# EasyEDA Pro project ProPrj_CraftVia-Station-S-v1-Rev0_2026-09-30.epro, board PCB1
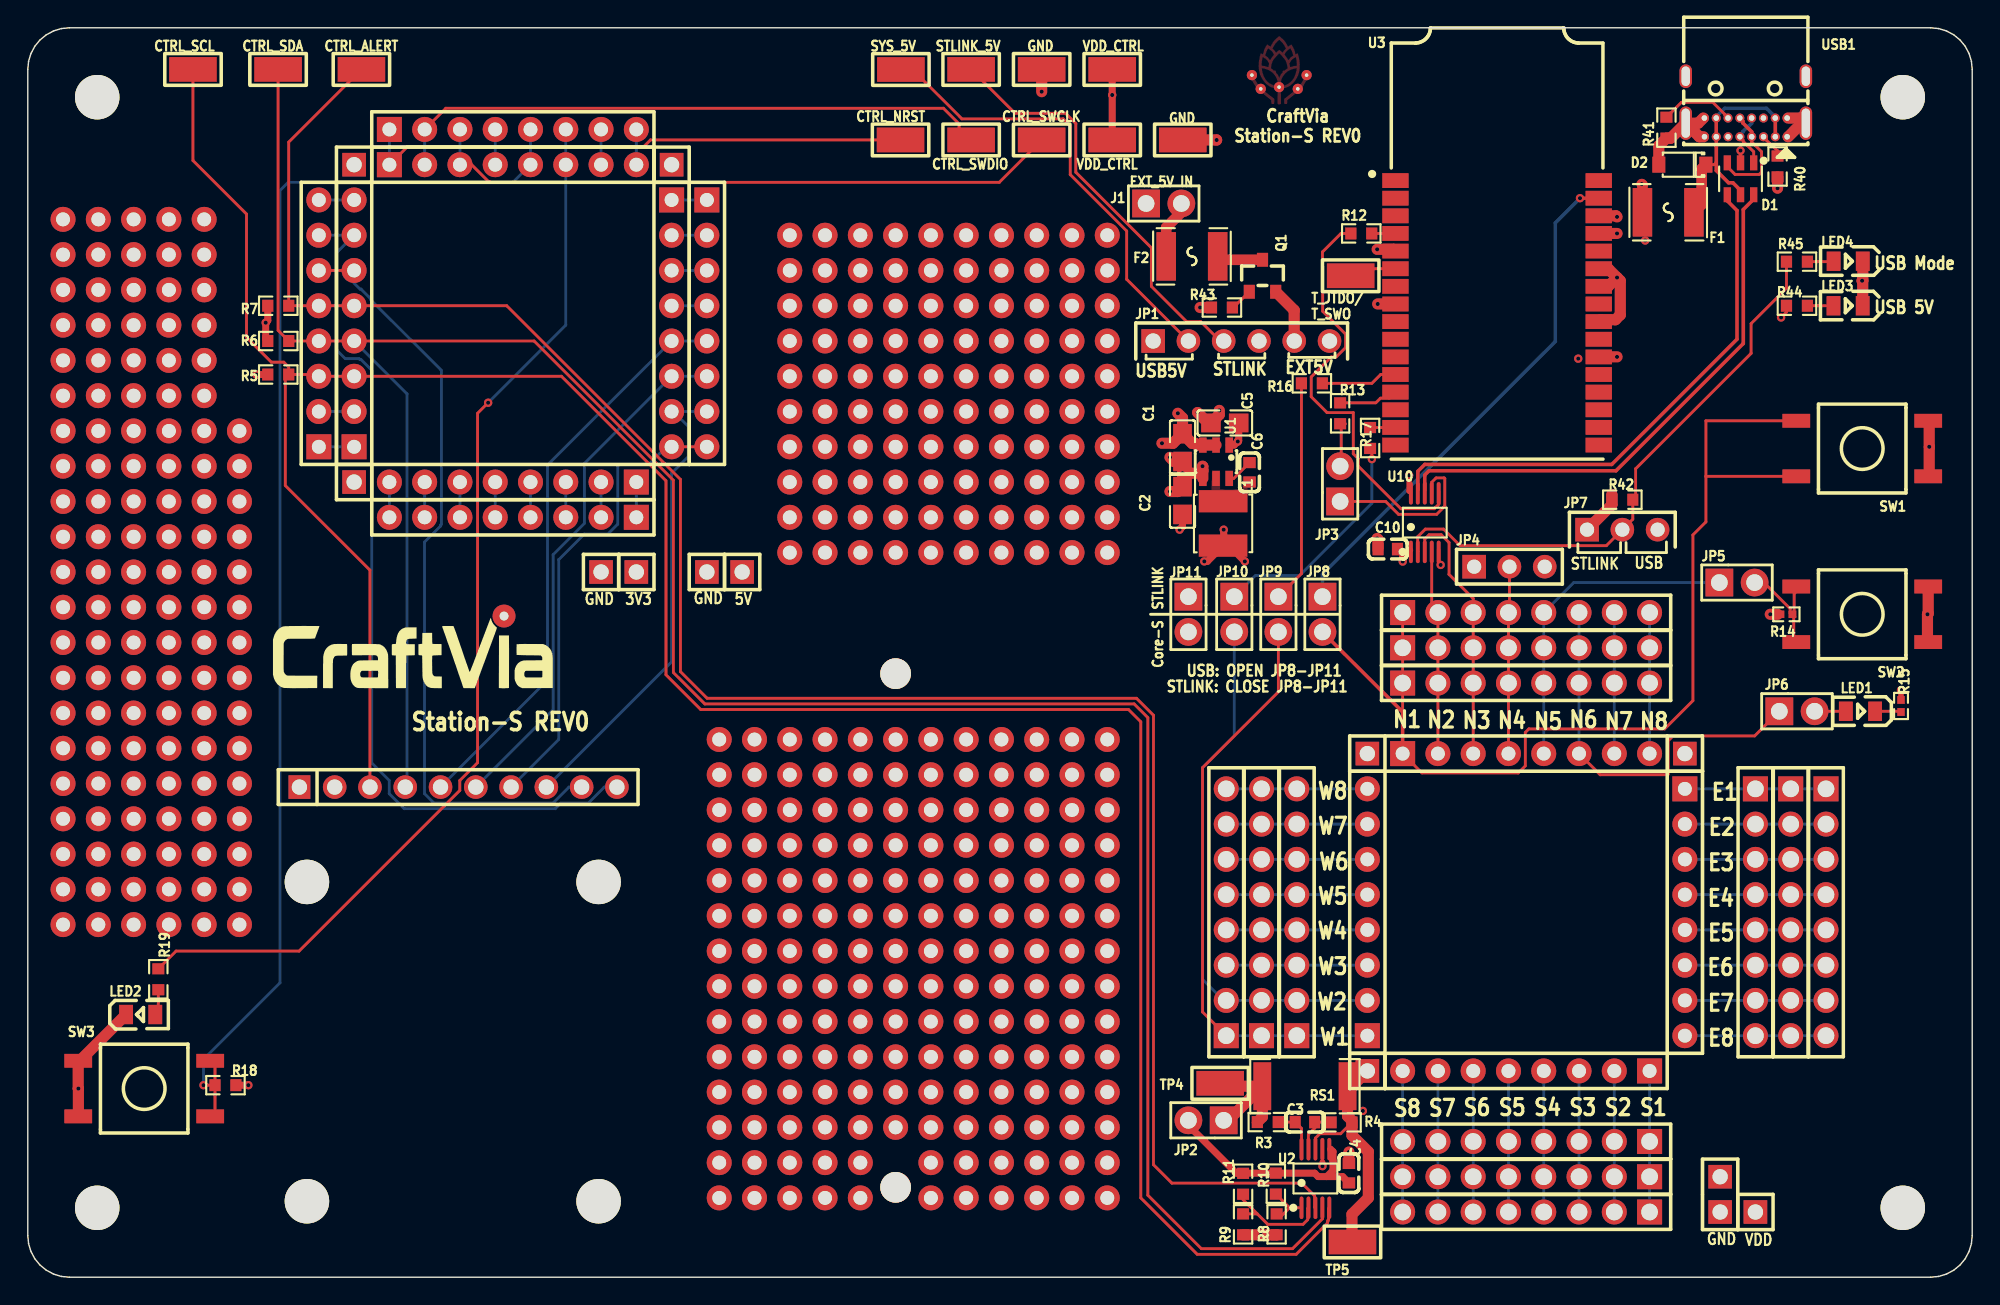
[diagram p7: board, top side]
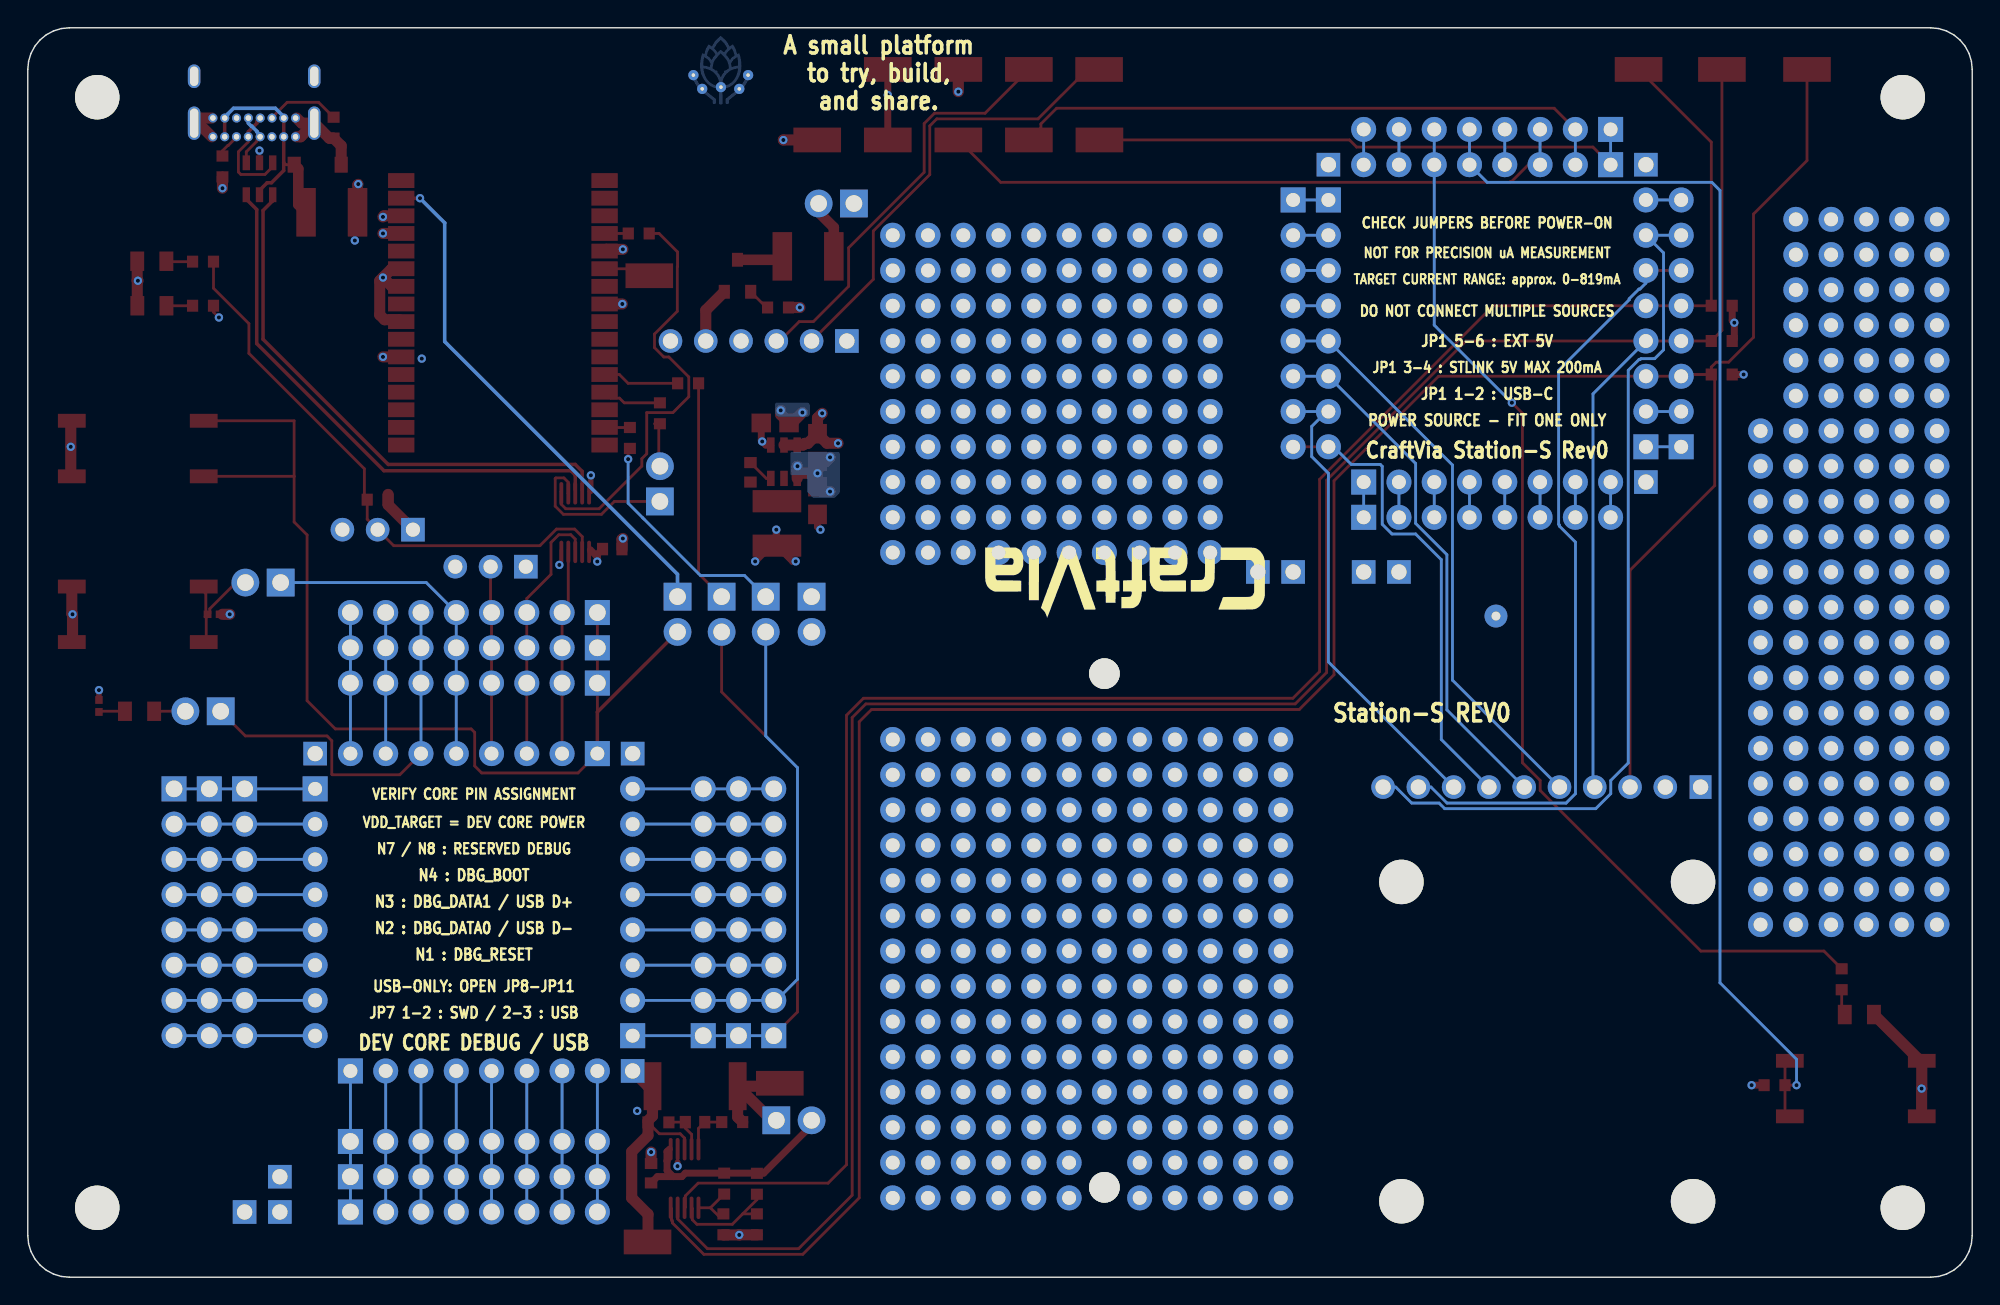
[diagram p8: board, bottom side, seen from below]

Outline 140 x 90 mm; copper layers: Top Layer, L2_GND, L3_PWR_SIG, Bottom Layer. Coordinates in mm from the lower left corner of the outline.
Outline path: 0,87 0.06,87.59 0.23,88.15 0.51,88.67 0.88,89.12 1.33,89.49 1.85,89.77 2.41,89.94 3,90 137,90 137.59,89.94 138.15,89.77 138.67,89.49 139.12,89.12 139.49,88.67 139.77,88.15 139.94,87.59 140,87 140,3 139.94,2.41 139.77,1.85 139.49,1.33 139.12,0.88 138.67,0.51 138.15,0.23 137.59,0.06 137,0 3,0 2.41,0.06 1.85,0.23 1.33,0.51 0.88,0.88 0.51,1.33 0.23,1.85 0.06,2.41 0,3 0,87
Stack: Top Layer 0.035mm / Dielectric1 1.51mm FR4 er 4.5 / Bottom Layer 0.035mm

## Design rules (mm)
spacing copperThickness1oz (default): track to track 0.2, other pairs 0.2 to 0.3
spacing copperThickness2oz: track to track 0.203, other pairs 0.152 to 0.3
track width copperThickness1oz (default): min 0.152, default 0.203, max 2.54
track width copperThickness2oz: min 0.203, default 0.254, max 2.54
track width powerTrack: min 0.203, default 0.8, max 2.54
track width powerTrackMedium: min 0.203, default 0.5, max 2.54
differential pair differentialPair (default): width min 0.127, default 0.254, max 2.54; gap min 0.152, default 0.152
net SYS_5V uses powerTrack
net GND uses copperRegion, powerTrack
net VDD_CTRL uses copperRegion, powerTrackMedium
net VDD_TARGET uses copperRegion, powerTrack
net EXT_5V uses powerTrack
net STLINK_5V uses powerTrack
net VDD_SHUNT_IN uses powerTrack
net $1N111 uses copperRegion
pour e1534 uses copperRegion1, default

## Placement (name value [footprint] x y rotation side)
C1  10uF  [C0805]  83.14 59.76 270 top
C2  22uF  [C0805]  83.14 55.95 90 top
C3  100nF  [C0603]  91.96 11.17 0 top
C4  100nF  [C0603]  95.12 7.49 270 top
C5  22uF  [C0805]  86.19 61.53 180 top
C6  100nF  [C0603]  87.97 57.98 270 top
C10  100nF  [C0603]  97.92 52.45 0 top
D1  USB ESD  [SOT-23-6_L2.9-W1.6-P0.95-LS2.8-BL]  123.32 79.12 180 top
D2  USB-C VBUS TVS  [SOD-123_L2.8-W1.8-LS3.7-RD]  119.13 80.14 180 top
F1  USB-C VBUS PTC 1.1A  [F1812]  118.11 76.71 180 top
F2  MF-MSMF050-2  [F1812]  83.82 73.53 0 top
H1  DEV_CORE_NORTH  [HDR-TH_8P-P2.54-V-M]  107.88 37.72 0 top
H2  DEV_CORE_WEST  [HDR-TH_8P-P2.54-V-M]  96.45 26.29 90 top
H3  DEV_CORE_EAST  [HDR-TH_8P-P2.54-V-M]  119.31 26.29 270 top
H4  DEV_CORE_SOUTH  [HDR-TH_8P-P2.54-V-M]  107.88 14.86 180 top
H5  DEV_KNW_SOCKET_TBD  [HDR-TH_1P-P2.54-V-M]  96.45 37.72 180 top
H6  DEV_KNE_SOCKET_TBD  [HDR-TH_1P-P2.54-V-M]  119.31 37.72 180 top
H7  DEV_KSW_SOCKET_TBD  [HDR-TH_1P-P2.54-V-M]  96.45 14.86 180 top
H8  GPIO_N_A  [HDR-TH_8P-P2.54-V-F-1]  107.88 42.8 0 top
H9  GPIO_N_B  [HDR-TH_8P-P2.54-V-F-1]  107.88 45.34 0 top
H10  GPIO_N_C  [HDR-TH_8P-P2.54-V-F-1]  107.88 47.88 0 top
H11  GPIO_E_A  [HDR-TH_8P-P2.54-V-F-1]  124.39 26.29 270 top
H12  GPIO_E_B  [HDR-TH_8P-P2.54-V-F-1]  126.93 26.29 270 top
H13  GPIO_E_C  [HDR-TH_8P-P2.54-V-F-1]  129.47 26.29 270 top
H14  GPIO_S_A  [HDR-TH_8P-P2.54-V-F-1]  107.88 9.78 180 top
H15  GPIO_S_B  [HDR-TH_8P-P2.54-V-F-1]  107.88 7.24 180 top
H16  GPIO_S_C  [HDR-TH_8P-P2.54-V-F-1]  107.88 4.7 180 top
H17  GPIO_W_A  [HDR-TH_8P-P2.54-V-F-1]  91.37 26.29 90 top
H18  GPIO_W_B  [HDR-TH_8P-P2.54-V-F-1]  88.83 26.29 90 top
H19  GPIO_W_C  [HDR-TH_8P-P2.54-V-F-1]  86.29 26.29 90 top
H20  CTRL_CORE_NORTH  [HDR-TH_8P-P2.54-V-M]  34.93 80.14 0 top
H21  CTRL_CORE_EAST  [HDR-TH_8P-P2.54-V-M]  46.36 68.71 270 top
H22  CTRL_CORE_SOUTH  [HDR-TH_8P-P2.54-V-M]  34.93 57.28 180 top
H23  CTRL_CORE_WEST  [HDR-TH_8P-P2.54-V-M]  23.5 68.71 90 top
H24  CTRL_KNW_SOCKET_TBD  [HDR-TH_1P-P2.54-V-M]  23.5 80.14 180 top
H25  CTRL_KNE_SOCKET_TBD  [HDR-TH_1P-P2.54-V-M]  46.36 80.14 180 top
H26  CTRL_KSW_SOCKET_TBD  [HDR-TH_1P-P2.54-V-M]  23.5 57.28 180 top
H27  LCD_I2C_SPI  [HDR-TH_10P-P2.54-V-F]  30.99 35.31 0 top
H28  CTRL_BREAKOUT_NORTH  [HDR-TH_8P-P2.54-V-M]  34.93 82.68 0 top
H29  CTRL_BREAKOUT_EAST  [HDR-TH_8P-P2.54-V-M]  48.9 68.71 270 top
H30  CTRL_BREAKOUT_SOUTH  [HDR-TH_8P-P2.54-V-M]  34.93 54.74 180 top
H31  CTRL_BREAKOUT_WEST  [HDR-TH_8P-P2.54-V-M]  20.96 68.71 90 top
H32  CTRL_BREAKOUT_VDD  [HDR-TH_1P-P2.54-V-M]  43.82 50.8 180 top
H33  CTRL_BREAKOUT_GND1  [HDR-TH_1P-P2.54-V-M]  48.9 50.8 180 top
H34  CTRL_BREAKOUT_GND2  [HDR-TH_1P-P2.54-V-M]  41.28 50.8 180 top
H35  DEV_BREAKOUT_VDD_TARGET  [HDR-TH_1P-P2.54-V-M]  124.39 4.7 0 top
H36  DEV_BREAKOUT_GND1  [HDR-TH_1P-P2.54-V-M]  121.85 4.7 0 top
H37  DEV_BREAKOUT_GND2  [HDR-TH_1P-P2.54-V-M]  121.85 7.24 0 top
H38  CTRL_BREAKOUT_SYS5V  [HDR-TH_1P-P2.54-V-M]  51.44 50.8 0 top
J1  PZ254V-11-02P  [HDR-TH_2P-P2.54-V-M]  81.79 77.34 0 top
JP1  PWR SOURCE: 1-2 USB-C / 3-4 STLINK / 5-6 EXT; FIT ONE ONLY  [HDR-TH_6P-P2.54-V-M]  87.38 67.44 0 top
JP2  PZ254V-11-02P  [HDR-TH_2P-P2.54-V-M]  84.84 11.3 180 top
JP3  PZ254V-11-02P  [HDR-TH_2P-P2.54-V-M]  94.49 57.15 90 top
JP4  BOOT_SEL  [HDR-TH_3P-P2.54-V-M_PZ254V-11-03P]  106.68 51.18 0 top
JP5  USER_BTN_EN (DEFAULT SHORT)  [HDR-TH_2P-P2.54-V-M]  123.06 50.04 0 top
JP6  USER_LED_EN (DEFAULT SHORT)  [HDR-TH_2P-P2.54-V-M]  127.38 40.77 0 top
JP7  DBG MODE: 1-2 SWD / 2-3 USB  [HDR-TH_3P-P2.54-V-M_PZ254V-11-03P]  114.81 53.85 0 top
JP8  NRST_ISO - FIT FOR STLINK / OPEN FOR ESP USB  [HDR-TH_2P-P2.54-V-M]  93.22 47.75 270 top
JP9  VCP_TX_ISO - FIT FOR STLINK / OPEN FOR ESP USB  [HDR-TH_2P-P2.54-V-M]  90.04 47.75 270 top
JP10  VCP_RX_ISO - FIT FOR STLINK / OPEN FOR ESP USB  [HDR-TH_2P-P2.54-V-M]  86.87 47.75 270 top
JP11  T_VCC_ISO - FIT FOR STLINK / OPEN FOR USB-ONLY  [HDR-TH_2P-P2.54-V-M]  83.57 47.75 270 top
L1  4.7uH  [IND-SMD_L4.0-W4.0]  86.06 54.3 270 top
LED1  DEV_USER_LED_GREEN  [LED0805-R-RD]  131.95 40.77 180 top
LED2  STATION_STATUS_GREEN  [LED0805-R-RD]  8.13 18.92 0 top
LED3  USB VBUS GREEN  [LED0805-R-RD]  131.06 69.98 180 top
LED4  USB MODE GREEN  [LED0805-R-RD]  131.07 73.18 180 top
NOREF  -  [Pad_e608]  2.54 48.26 0 top
NOREF#2  -  [Pad_e371]  57.4 67.44 0 top
NOREF#3  -  [Pad_e320]  65.02 52.2 0 top
NOREF#4  -  [Pad_e1858]  88.14 86.59 0 top
NOREF#5  -  [Pad_e611]  10.16 48.26 0 top
NOREF#6  -  [Pad_e309]  20.1 28.47 0 top
NOREF#7  -  [Pad_e614]  2.54 50.8 0 top
NOREF#8  -  [Pad_e335]  57.4 57.28 0 top
NOREF#9  -  [Pad_e1862]  91.44 85.6 0 top
NOREF#10  -  [Pad_e585]  5.08 38.1 0 top
NOREF#11  -  [Pad_e652]  10.16 66.04 0 top
NOREF#12  -  [Pad_e586]  7.62 38.1 0 top
NOREF#13  -  [Pad_e351]  75.18 59.82 0 top
NOREF#14  -  [Pad_e625]  15.24 53.34 0 top
NOREF#15  -  [Pad_e505]  57.4 28.58 0 top
NOREF#16  -  [Pad_e405]  77.72 72.52 0 top
NOREF#17  -  [Pad_e517]  62.48 31.11 0 top
NOREF#18  -  [Pad_e469]  67.56 18.41 0 top
NOREF#19  -  [Pad_e511]  72.64 28.58 0 top
NOREF#20  -  [Pad_e346]  62.48 59.82 0 top
NOREF#21  -  [Pad_e1707]  52.32 31.11 0 top
NOREF#22  -  [Pad_e621]  5.08 53.34 0 top
NOREF#23  -  [Pad_e375]  67.56 67.44 0 top
NOREF#24  -  [Pad_e658]  12.7 68.58 0 top
NOREF#25  -  [Pad_e399]  77.72 57.28 0 top
NOREF#26  -  [Pad_e522]  75.18 31.11 0 top
NOREF#27  -  [Pad_e484]  54.86 23.5 0 top
NOREF#28  -  [Pad_e355]  62.48 62.36 0 top
NOREF#29  -  [Pad_e521]  72.64 31.11 0 top
NOREF#30  -  [Pad_e413]  72.64 75.06 0 top
NOREF#31  -  [Pad_e1723]  52.32 23.5 0 top
NOREF#32  -  [Pad_e390]  59.94 72.52 0 top
NOREF#33  -  [Pad_e537]  62.48 36.19 0 top
NOREF#34  -  [Pad_e662]  10.16 71.12 0 top
NOREF#35  -  [Pad_e379]  54.86 69.98 0 top
NOREF#36  -  [Pad_e669]  2.54 76.2 0 top
NOREF#37  -  [Pad_e377]  72.64 67.44 0 top
NOREF#38  -  [Pad_e1716]  52.32 8.25 0 top
NOREF#39  -  [Pad_e536]  59.94 36.19 0 top
NOREF#40  -  [Pad_e567]  5.08 30.48 0 top
NOREF#41  -  [Pad_e441]  72.64 10.79 0 top
NOREF#42  -  [Pad_e615]  5.08 50.8 0 top
NOREF#43  -  [Pad_e402]  77.72 64.9 0 top
NOREF#44  -  [Pad_e482]  75.18 20.96 0 top
NOREF#45  -  [Pad_e1715]  49.78 5.72 0 top
NOREF#46  -  [Pad_e392]  65.02 72.52 0 top
NOREF#47  -  [Pad_e1719]  49.78 18.41 0 top
NOREF#48  -  [Pad_e1703]  52.32 26.03 0 top
NOREF#49  -  [Pad_e618]  12.7 50.8 0 top
NOREF#50  -  [Pad_e481]  72.64 20.96 0 top
NOREF#51  -  [Pad_e549]  67.56 38.73 0 top
NOREF#52  -  [Pad_e594]  12.7 40.64 0 top
NOREF#53  -  [Pad_e1712]  52.32 38.73 0 top
NOREF#54  -  [Pad_e347]  65.02 59.82 0 top
NOREF#55  -  [Pad_e668]  12.7 73.66 0 top
NOREF#56  -  [Pad_e1787]  34.29 47.62 0 top
NOREF#57  -  [Pad_e354]  59.94 62.36 0 top
NOREF#58  -  [Pad_e600]  12.7 43.18 0 top
NOREF#59  -  [Pad_e508]  65.02 28.58 0 top
NOREF#60  -  [Pad_e381]  59.94 69.98 0 top
NOREF#61  -  [Pad_e424]  77.72 5.72 0 top
NOREF#62  -  [Pad_e545]  57.4 38.73 0 top
NOREF#63  -  [Pad_e471]  72.64 18.41 0 top
NOREF#64  -  [Pad_e319]  62.48 52.2 0 top
NOREF#65  -  [Pad_e426]  57.4 8.25 0 top
NOREF#66  -  [Pad_e427]  59.94 8.25 0 top
NOREF#67  -  [Pad_e394]  70.1 72.52 0 top
NOREF#68  -  [Pad_e329]  65.02 54.74 0 top
NOREF#69  -  [Pad_e570]  12.7 30.48 0 top
NOREF#70  -  [Pad_e626]  2.54 55.88 0 top
NOREF#71  -  [Pad_e367]  70.1 64.9 0 top
NOREF#72  -  [Pad_e643]  15.24 60.96 0 top
NOREF#73  -  [Pad_e637]  15.24 58.42 0 top
NOREF#74  -  [Pad_e665]  5.08 73.66 0 top
NOREF#75  -  [Pad_e664]  2.54 73.66 0 top
NOREF#76  -  [Pad_e323]  72.64 52.2 0 top
NOREF#77  -  [Pad_e528]  65.02 33.66 0 top
NOREF#78  -  [Pad_e408]  59.94 75.06 0 top
NOREF#79  -  [Pad_e613]  15.24 48.26 0 top
NOREF#80  -  [Pad_e324]  75.18 52.2 0 top
NOREF#81  -  [Pad_e555]  5.08 25.4 0 top
NOREF#82  -  [Pad_e659]  2.54 71.12 0 top
NOREF#83  -  [Pad_e544]  54.86 38.73 0 top
NOREF#84  -  [Pad_e575]  10.16 33.02 0 top
NOREF#85  -  [Pad_e655]  5.08 68.58 0 top
NOREF#86  -  [Pad_e497]  62.48 26.03 0 top
NOREF#87  -  [Pad_e477]  62.48 20.96 0 top
NOREF#88  -  [Pad_e464]  54.86 18.41 0 top
NOREF#89  -  [Pad_e483]  77.72 20.96 0 top
NOREF#90  -  [Pad_e428]  65.02 8.25 0 top
NOREF#91  -  [Pad_e607]  15.24 45.72 0 top
NOREF#92  -  [Pad_e547]  62.48 38.73 0 top
NOREF#93  -  [Pad_e337]  62.48 57.28 0 top
NOREF#94  -  [Pad_e556]  7.62 25.4 0 top
NOREF#95  -  [Pad_e450]  70.1 13.34 0 top
NOREF#96  -  [Pad_e661]  7.62 71.12 0 top
NOREF#97  -  [Pad_e1718]  49.78 10.79 0 top
NOREF#98  -  [Pad_e1722]  49.78 20.96 0 top
NOREF#99  -  [Pad_e327]  59.94 54.74 0 top
NOREF#100  -  [Pad_e548]  65.02 38.73 0 top
NOREF#101  -  [Pad_e515]  57.4 31.11 0 top
NOREF#102  -  [Pad_e453]  77.72 13.34 0 top
NOREF#103  -  [Pad_e1726]  52.32 13.34 0 top
NOREF#104  -  [Pad_e407]  57.4 75.06 0 top
NOREF#105  -  [Pad_e437]  62.48 10.79 0 top
NOREF#106  -  [Pad_e363]  59.94 64.9 0 top
NOREF#107  -  [Pad_e376]  70.1 67.44 0 top
NOREF#108  -  [Pad_e1702]  49.78 26.03 0 top
NOREF#109  -  [Pad_e294]  135 85 0 top
NOREF#110  -  [Pad_e328]  62.48 54.74 0 top
NOREF#111  -  [Pad_e489]  67.56 23.5 0 top
NOREF#112  -  [Pad_e496]  59.94 26.03 0 top
NOREF#113  -  [Pad_e432]  75.18 8.25 0 top
NOREF#114  -  [Pad_e518]  65.02 31.11 0 top
NOREF#115  -  [Pad_e352]  54.86 62.36 0 top
NOREF#116  -  [Pad_e360]  75.18 62.36 0 top
NOREF#117  -  [Pad_e1717]  49.78 8.25 0 top
NOREF#118  -  [Pad_e472]  75.18 18.41 0 top
NOREF#119  -  [Pad_e461]  72.64 15.88 0 top
NOREF#120  -  [Pad_e325]  54.86 54.74 0 top
NOREF#121  -  [Pad_e498]  65.02 26.03 0 top
NOREF#122  -  [Pad_e1701]  49.78 23.5 0 top
NOREF#123  -  [Pad_e434]  54.86 10.79 0 top
NOREF#124  -  [Pad_e401]  77.72 62.36 0 top
NOREF#125  -  [Pad_e653]  12.7 66.04 0 top
NOREF#126  -  [Pad_e574]  7.62 33.02 0 top
NOREF#127  -  [Pad_e465]  57.4 18.41 0 top
NOREF#128  -  [Pad_e334]  54.86 57.28 0 top
NOREF#129  -  [Pad_e667]  10.16 73.66 0 top
NOREF#130  -  [Pad_e599]  10.16 43.18 0 top
NOREF#131  -  [Pad_e1727]  49.78 15.88 0 top
NOREF#132  -  [Pad_e474]  54.86 20.96 0 top
NOREF#133  -  [Pad_e568]  7.62 30.48 0 top
NOREF#134  -  [Pad_e433]  77.72 8.25 0 top
NOREF#135  -  [Pad_e553]  77.72 38.73 0 top
NOREF#136  -  [Pad_e589]  15.24 38.1 0 top
NOREF#137  -  [Pad_e430]  70.1 8.25 0 top
NOREF#138  -  [Pad_e523]  77.72 31.11 0 top
NOREF#139  -  [Pad_e564]  12.7 27.94 0 top
NOREF#140  -  [Pad_e533]  77.72 33.66 0 top
NOREF#141  -  [Pad_e660]  5.08 71.12 0 top
NOREF#142  -  [Pad_e454]  54.86 15.88 0 top
NOREF#143  -  [Pad_e421]  70.1 5.72 0 top
NOREF#144  -  [Pad_e386]  72.64 69.98 0 top
NOREF#145  -  [Pad_e598]  7.62 43.18 0 top
NOREF#146  -  [Pad_e485]  57.4 23.5 0 top
NOREF#147  -  [Pad_e604]  7.62 45.72 0 top
NOREF#148  -  [Pad_e411]  67.56 75.06 0 top
NOREF#149  -  [Pad_e620]  2.54 53.34 0 top
NOREF#150  -  [Pad_e507]  62.48 28.58 0 top
NOREF#151  -  [Pad_e562]  7.62 27.94 0 top
NOREF#152  -  [Pad_e622]  7.62 53.34 0 top
NOREF#153  -  [Pad_e647]  10.16 63.5 0 top
NOREF#154  -  [Pad_e534]  54.86 36.19 0 top
NOREF#155  -  [Pad_e365]  65.02 64.9 0 top
NOREF#156  -  [Pad_e560]  2.54 27.94 0 top
NOREF#157  -  [Pad_e1713]  49.78 38.73 0 top
NOREF#158  -  [Pad_e385]  70.1 69.98 0 top
NOREF#159  -  [Pad_e388]  54.86 72.52 0 top
NOREF#160  -  [Pad_e503]  77.72 26.03 0 top
NOREF#161  -  [Pad_e451]  72.64 13.34 0 top
NOREF#162  -  [Pad_e410]  65.02 75.06 0 top
NOREF#163  -  [Pad_e380]  57.4 69.98 0 top
NOREF#164  -  [Pad_e391]  62.48 72.52 0 top
NOREF#165  -  [Pad_e396]  75.18 72.52 0 top
NOREF#166  -  [Pad_e559]  15.24 25.4 0 top
NOREF#167  -  [Pad_e636]  12.7 58.42 0 top
NOREF#168  -  [Pad_e644]  2.54 63.5 0 top
NOREF#169  -  [Pad_e349]  70.1 59.82 0 top
NOREF#170  -  [Pad_e448]  65.02 13.34 0 top
NOREF#171  -  [Pad_e344]  57.4 59.82 0 top
NOREF#172  -  [Pad_e444]  54.86 13.34 0 top
NOREF#173  -  [Pad_e634]  7.62 58.42 0 top
NOREF#174  -  [Pad_e307]  20.1 5.47 0 top
NOREF#175  -  [Pad_e631]  15.24 55.88 0 top
NOREF#176  -  [Pad_e1710]  49.78 36.19 0 top
NOREF#177  -  [Pad_e455]  57.4 15.88 0 top
NOREF#178  -  [Pad_e384]  67.56 69.98 0 top
NOREF#179  -  [Pad_e291]  5 5 0 top
NOREF#180  -  [Pad_e649]  2.54 66.04 0 top
NOREF#181  -  [Pad_e550]  70.1 38.73 0 top
NOREF#182  -  [Pad_e418]  59.94 5.72 0 top
NOREF#183  -  [Pad_e525]  57.4 33.66 0 top
NOREF#184  -  [Pad_e542]  75.18 36.19 0 top
NOREF#185  -  [Pad_e624]  12.7 53.34 0 top
NOREF#186  -  [Pad_e506]  59.94 28.58 0 top
NOREF#187  -  [Pad_e331]  70.1 54.74 0 top
NOREF#188  -  [Pad_e479]  67.56 20.96 0 top
NOREF#189  -  [Pad_e612]  12.7 48.26 0 top
NOREF#190  -  [Pad_e1714]  52.32 5.72 0 top
NOREF#191  -  [Pad_e571]  15.24 30.48 0 top
NOREF#192  -  [Pad_e416]  54.86 5.72 0 top
NOREF#193  -  [Pad_e663]  12.7 71.12 0 top
NOREF#194  -  [Pad_e1709]  52.32 33.66 0 top
NOREF#195  -  [Pad_e648]  12.7 63.5 0 top
NOREF#196  -  [Pad_e343]  54.86 59.82 0 top
NOREF#197  -  [Pad_e366]  67.56 64.9 0 top
NOREF#198  -  [Pad_e633]  5.08 58.42 0 top
NOREF#199  -  [Pad_e577]  15.24 33.02 0 top
NOREF#200  -  [Pad_e403]  77.72 67.44 0 top
NOREF#201  -  [Pad_e406]  54.86 75.06 0 top
NOREF#202  -  [Pad_e654]  2.54 68.58 0 top
NOREF#203  -  [Pad_e373]  62.48 67.44 0 top
NOREF#204  -  [Pad_e639]  5.08 60.96 0 top
NOREF#205  -  [Pad_e573]  5.08 33.02 0 top
NOREF#206  -  [Pad_e316]  54.86 52.2 0 top
NOREF#207  -  [Pad_e635]  10.16 58.42 0 top
NOREF#208  -  [Pad_e1859]  92.07 86.59 0 top
NOREF#209  -  [Pad_e601]  15.24 43.18 0 top
NOREF#210  -  [Pad_e442]  75.18 10.79 0 top
NOREF#211  -  [Pad_e467]  62.48 18.41 0 top
NOREF#212  -  [Pad_e603]  5.08 45.72 0 top
NOREF#213  -  [Pad_e596]  2.54 43.18 0 top
NOREF#214  -  [Pad_e602]  2.54 45.72 0 top
NOREF#215  -  [Pad_e458]  65.02 15.88 0 top
NOREF#216  -  [Pad_e326]  57.4 54.74 0 top
NOREF#217  -  [Pad_e565]  15.24 27.94 0 top
NOREF#218  -  [Pad_e419]  65.02 5.72 0 top
NOREF#219  -  [Pad_e530]  70.1 33.66 0 top
NOREF#220  -  [Pad_e372]  59.94 67.44 0 top
NOREF#221  -  [Pad_e457]  62.48 15.88 0 top
NOREF#222  -  [Pad_e671]  7.62 76.2 0 top
NOREF#223  -  [Pad_e1704]  49.78 28.58 0 top
NOREF#224  -  [Pad_e527]  62.48 33.66 0 top
NOREF#225  -  [Pad_e646]  7.62 63.5 0 top
NOREF#226  -  [Pad_e383]  65.02 69.98 0 top
NOREF#227  -  [Pad_e480]  70.1 20.96 0 top
NOREF#228  -  [Pad_e526]  59.94 33.66 0 top
NOREF#229  -  [Pad_e382]  62.48 69.98 0 top
NOREF#230  -  [Pad_e456]  59.94 15.88 0 top
NOREF#231  -  [Pad_e333]  75.18 54.74 0 top
NOREF#232  -  [Pad_e423]  75.18 5.72 0 top
NOREF#233  -  [Pad_e610]  7.62 48.26 0 top
NOREF#234  -  [Pad_e439]  67.56 10.79 0 top
NOREF#235  -  [Pad_e353]  57.4 62.36 0 top
NOREF#236  -  [Pad_e561]  5.08 27.94 0 top
NOREF#237  -  [Pad_e591]  5.08 40.64 0 top
NOREF#238  -  [Pad_e340]  70.1 57.28 0 top
NOREF#239  -  [Pad_e581]  10.16 35.56 0 top
NOREF#240  -  [Pad_e563]  10.16 27.94 0 top
NOREF#241  -  [Pad_e1860]  90.09 85.72 0 top
NOREF#242  -  [Pad_e632]  2.54 58.42 0 top
NOREF#243  -  [Pad_e463]  77.72 15.88 0 top
NOREF#244  -  [Pad_e1725]  49.78 13.34 0 top
NOREF#245  -  [Pad_e342]  75.18 57.28 0 top
NOREF#246  -  [Pad_e551]  72.64 38.73 0 top
NOREF#247  -  [Pad_e493]  77.72 23.5 0 top
NOREF#248  -  [Pad_e292]  135 5 0 top
NOREF#249  -  [Pad_e606]  12.7 45.72 0 top
NOREF#250  -  [Pad_e539]  67.56 36.19 0 top
NOREF#251  -  [Pad_e338]  65.02 57.28 0 top
NOREF#252  -  [Pad_e509]  67.56 28.58 0 top
NOREF#253  -  [Pad_e369]  75.18 64.9 0 top
NOREF#254  -  [Pad_e310]  41.1 28.47 0 top
NOREF#255  -  [Pad_e445]  57.4 13.34 0 top
NOREF#256  -  [Pad_e398]  77.72 54.74 0 top
NOREF#257  -  [Pad_e629]  10.16 55.88 0 top
NOREF#258  -  [Pad_e1121]  62.48 6.48 0 top
NOREF#259  -  [Pad_e387]  75.18 69.98 0 top
NOREF#260  -  [Pad_e595]  15.24 40.64 0 top
NOREF#261  -  [Pad_e491]  72.64 23.5 0 top
NOREF#262  -  [Pad_e429]  67.56 8.25 0 top
NOREF#263  -  [Pad_e554]  2.54 25.4 0 top
NOREF#264  -  [Pad_e546]  59.94 38.73 0 top
NOREF#265  -  [Pad_e490]  70.1 23.5 0 top
NOREF#266  -  [Pad_e672]  10.16 76.2 0 top
NOREF#267  -  [Pad_e486]  59.94 23.5 0 top
NOREF#268  -  [Pad_e628]  7.62 55.88 0 top
NOREF#269  -  [Pad_e642]  12.7 60.96 0 top
NOREF#270  -  [Pad_e566]  2.54 30.48 0 top
NOREF#271  -  [Pad_e579]  5.08 35.56 0 top
NOREF#272  -  [Pad_e541]  72.64 36.19 0 top
NOREF#273  -  [Pad_e578]  2.54 35.56 0 top
NOREF#274  -  [Pad_e538]  65.02 36.19 0 top
NOREF#275  -  [Pad_e584]  2.54 38.1 0 top
NOREF#276  -  [Pad_e452]  75.18 13.34 0 top
NOREF#277  -  [Pad_e609]  5.08 48.26 0 top
NOREF#278  -  [Pad_e540]  70.1 36.19 0 top
NOREF#279  -  [Pad_e1720]  52.32 18.41 0 top
NOREF#280  -  [Pad_e422]  72.64 5.72 0 top
NOREF#281  -  [Pad_e449]  67.56 13.34 0 top
NOREF#282  -  [Pad_e495]  57.4 26.03 0 top
NOREF#283  -  [Pad_e623]  10.16 53.34 0 top
NOREF#284  -  [Pad_e1711]  52.32 36.19 0 top
NOREF#285  -  [Pad_e512]  75.18 28.58 0 top
NOREF#286  -  [Pad_e529]  67.56 33.66 0 top
NOREF#287  -  [Pad_e293]  5 85 0 top
NOREF#288  -  [Pad_e435]  57.4 10.79 0 top
NOREF#289  -  [Pad_e502]  75.18 26.03 0 top
NOREF#290  -  [Pad_e357]  67.56 62.36 0 top
NOREF#291  -  [Pad_e514]  54.86 31.11 0 top
NOREF#292  -  [Pad_e364]  62.48 64.9 0 top
NOREF#293  -  [Pad_e650]  5.08 66.04 0 top
NOREF#294  -  [Pad_e494]  54.86 26.03 0 top
NOREF#295  -  [Pad_e459]  67.56 15.88 0 top
NOREF#296  -  [Pad_e438]  65.02 10.79 0 top
NOREF#297  -  [Pad_e590]  2.54 40.64 0 top
NOREF#298  -  [Pad_e519]  67.56 31.11 0 top
NOREF#299  -  [Pad_e499]  67.56 26.03 0 top
NOREF#300  -  [Pad_e630]  12.7 55.88 0 top
NOREF#301  -  [Pad_e348]  67.56 59.82 0 top
NOREF#302  -  [Pad_e332]  72.64 54.74 0 top
NOREF#303  -  [Pad_e640]  7.62 60.96 0 top
NOREF#304  -  [Pad_e447]  62.48 13.34 0 top
NOREF#305  -  [Pad_e583]  15.24 35.56 0 top
NOREF#306  -  [Pad_e466]  59.94 18.41 0 top
NOREF#307  -  [Pad_e414]  75.18 75.06 0 top
NOREF#308  -  [Pad_e645]  5.08 63.5 0 top
NOREF#309  -  [Pad_e476]  59.94 20.96 0 top
NOREF#310  -  [Pad_e404]  77.72 69.98 0 top
NOREF#311  -  [Pad_e336]  59.94 57.28 0 top
NOREF#312  -  [Pad_e516]  59.94 31.11 0 top
NOREF#313  -  [Pad_e446]  59.94 13.34 0 top
NOREF#314  -  [Pad_e443]  77.72 10.79 0 top
NOREF#315  -  [Pad_e1724]  52.32 10.79 0 top
NOREF#316  -  [Pad_e617]  10.16 50.8 0 top
NOREF#317  -  [Pad_e520]  70.1 31.11 0 top
NOREF#318  -  [Pad_e638]  2.54 60.96 0 top
NOREF#319  -  [Pad_e588]  12.7 38.1 0 top
NOREF#320  -  [Pad_e317]  57.4 52.2 0 top
NOREF#321  -  [Pad_e415]  77.72 75.06 0 top
NOREF#322  -  [Pad_e673]  12.7 76.2 0 top
NOREF#323  -  [Pad_e358]  70.1 62.36 0 top
NOREF#324  -  [Pad_e468]  65.02 18.41 0 top
NOREF#325  -  [Pad_e431]  72.64 8.25 0 top
NOREF#326  -  [Pad_e656]  7.62 68.58 0 top
NOREF#327  -  [Pad_e420]  67.56 5.72 0 top
NOREF#328  -  [Pad_e651]  7.62 66.04 0 top
NOREF#329  -  [Pad_e470]  70.1 18.41 0 top
NOREF#330  -  [Pad_e389]  57.4 72.52 0 top
NOREF#331  -  [Pad_e395]  72.64 72.52 0 top
NOREF#332  -  [Pad_e350]  72.64 59.82 0 top
NOREF#333  -  [Pad_e487]  62.48 23.5 0 top
NOREF#334  -  [Pad_e412]  70.1 75.06 0 top
NOREF#335  -  [Pad_e619]  15.24 50.8 0 top
NOREF#336  -  [Pad_e552]  75.18 38.73 0 top
NOREF#337  -  [Pad_e535]  57.4 36.19 0 top
NOREF#338  -  [Pad_e330]  67.56 54.74 0 top
NOREF#339  -  [Pad_e473]  77.72 18.41 0 top
NOREF#340  -  [Pad_e1120]  62.48 43.48 0 top
NOREF#341  -  [Pad_e370]  54.86 67.44 0 top
NOREF#342  -  [Pad_e1708]  49.78 33.66 0 top
NOREF#343  -  [Pad_e409]  62.48 75.06 0 top
NOREF#344  -  [Pad_e569]  10.16 30.48 0 top
NOREF#345  -  [Pad_e558]  12.7 25.4 0 top
NOREF#346  -  [Pad_e425]  54.86 8.25 0 top
NOREF#347  -  [Pad_e532]  75.18 33.66 0 top
NOREF#348  -  [Pad_e582]  12.7 35.56 0 top
NOREF#349  -  [Pad_e393]  67.56 72.52 0 top
NOREF#350  -  [Pad_e580]  7.62 35.56 0 top
NOREF#351  -  [Pad_e362]  57.4 64.9 0 top
NOREF#352  -  [Pad_e322]  70.1 52.2 0 top
NOREF#353  -  [Pad_e417]  57.4 5.72 0 top
NOREF#354  -  [Pad_e361]  54.86 64.9 0 top
NOREF#355  -  [Pad_e359]  72.64 62.36 0 top
NOREF#356  -  [Pad_e543]  77.72 36.19 0 top
NOREF#357  -  [Pad_e627]  5.08 55.88 0 top
NOREF#358  -  [Pad_e378]  75.18 67.44 0 top
NOREF#359  -  [Pad_e339]  67.56 57.28 0 top
NOREF#360  -  [Pad_e436]  59.94 10.79 0 top
NOREF#361  -  [Pad_e341]  72.64 57.28 0 top
NOREF#362  -  [Pad_e587]  10.16 38.1 0 top
NOREF#363  -  [Pad_e308]  41.1 5.47 0 top
NOREF#364  -  [Pad_e440]  70.1 10.79 0 top
NOREF#365  -  [Pad_e531]  72.64 33.66 0 top
NOREF#366  -  [Pad_e1705]  52.32 28.58 0 top
NOREF#367  -  [Pad_e374]  65.02 67.44 0 top
NOREF#368  -  [Pad_e641]  10.16 60.96 0 top
NOREF#369  -  [Pad_e460]  70.1 15.88 0 top
NOREF#370  -  [Pad_e400]  77.72 59.82 0 top
NOREF#371  -  [Pad_e321]  67.56 52.2 0 top
NOREF#372  -  [Pad_e524]  54.86 33.66 0 top
NOREF#373  -  [Pad_e478]  65.02 20.96 0 top
NOREF#374  -  [Pad_e1721]  52.32 20.96 0 top
NOREF#375  -  [Pad_e368]  72.64 64.9 0 top
NOREF#376  -  [Pad_e356]  65.02 62.36 0 top
NOREF#377  -  [Pad_e513]  77.72 28.58 0 top
NOREF#378  -  [Pad_e557]  10.16 25.4 0 top
NOREF#379  -  [Pad_e510]  70.1 28.58 0 top
NOREF#380  -  [Pad_e397]  77.72 52.2 0 top
NOREF#381  -  [Pad_e576]  12.7 33.02 0 top
NOREF#382  -  [Pad_e605]  10.16 45.72 0 top
NOREF#383  -  [Pad_e475]  57.4 20.96 0 top
NOREF#384  -  [Pad_e500]  70.1 26.03 0 top
NOREF#385  -  [Pad_e593]  10.16 40.64 0 top
NOREF#386  -  [Pad_e616]  7.62 50.8 0 top
NOREF#387  -  [Pad_e1728]  52.32 15.88 0 top
NOREF#388  -  [Pad_e501]  72.64 26.03 0 top
NOREF#389  -  [Pad_e597]  5.08 43.18 0 top
NOREF#390  -  [Pad_e572]  2.54 33.02 0 top
NOREF#391  -  [Pad_e462]  75.18 15.88 0 top
NOREF#392  -  [Pad_e666]  7.62 73.66 0 top
NOREF#393  -  [Pad_e345]  59.94 59.82 0 top
NOREF#394  -  [Pad_e492]  75.18 23.5 0 top
NOREF#395  -  [Pad_e1706]  49.78 31.11 0 top
NOREF#396  -  [Pad_e488]  65.02 23.5 0 top
NOREF#397  -  [Pad_e504]  54.86 28.58 0 top
NOREF#398  -  [Pad_e1861]  88.77 85.6 0 top
NOREF#399  -  [Pad_e670]  5.08 76.2 0 top
NOREF#400  -  [Pad_e318]  59.94 52.2 0 top
NOREF#401  -  [Pad_e657]  10.16 68.58 0 top
NOREF#402  -  [Pad_e592]  7.62 40.64 0 top
Q1  AO3401A  [SOT-23_L2.9-W1.3-P1.90-LS2.4-BR]  88.9 72.14 270 top
R3  10Ω  [R0603]  89.28 11.18 0 top
R4  10Ω  [R0603]  94.59 11.16 0 top
R5  4.7kΩ  [R0603]  18.03 65.02 180 top
R6  4.7kΩ  [R0603]  18.03 67.44 180 top
R7  10kΩ  [R0603]  18.03 69.98 180 top
R8  0Ω  [R0603]  89.92 3.81 90 top
R9  0Ω  [R0603]  87.5 3.81 90 top
R10  0Ω  [R0603]  89.86 6.74 270 top
R11  0Ω  [R0603]  87.5 6.73 270 top
R12  0Ω  [R0603]  96.01 75.18 180 top
R13  0Ω  [R0603]  94.49 62.23 270 top
R14  10kΩ  [R0402]  126.62 47.75 180 top
R15  1kΩ  [R0402]  134.87 41.15 270 top
R16  0Ω  [R0603]  92.46 64.39 180 top
R17  0Ω  [R0603]  96.65 60.45 270 top
R18  10kΩ  [R0603]  14.23 13.83 180 top
R19  1kΩ  [R0603]  9.4 21.46 270 top
R40  5.1kΩ  [R0603]  125.98 80.01 90 top
R41  5.1kΩ  [R0603]  117.98 82.8 90 top
R42  100kΩ  [R0603]  114.81 56.01 0 top
R43  100kΩ  [R0603]  85.98 69.85 0 top
R44  2.2kΩ  [R0603]  127.38 69.98 0 top
R45  2.2kΩ  [R0603]  127.38 73.15 0 top
RS1  100mΩ  [R2512]  91.96 13.76 0 top
SW1  DEV_RESET  [SW-SMD_4P-L6.4-W6.3-P4.00-LS9.5]  132.08 59.69 0 top
SW2  DEV_USER  [SW-SMD_4P-L6.4-W6.3-P4.00-LS9.5]  132.08 47.75 0 top
SW3  STATION_USER  [SW-SMD_4P-L6.4-W6.3-P4.00-LS9.5]  8.38 13.59 180 top
TP1  STLINK_5V  [CONN-SMD_5017]  67.92 87 0 top
TP2  SYS_5V  [CONN-SMD_5017]  62.87 87 0 top
TP3  VDD_CTRL  [CONN-SMD_5017]  78.08 87 0 top
TP4  VDD_SHUNT_IN  [CONN-SMD_5017]  85.85 13.97 0 top
TP5  VDD_TARGET  [CONN-SMD_5017]  95.38 2.54 0 top
TP6  GND  [CONN-SMD_5017]  73 87 0 top
TP7  MEAS_SCL  [CONN-SMD_5017]  11.89 87 0 top
TP8  MEAS_SDA  [CONN-SMD_5017]  18.02 87 0 top
TP9  MEAS_ALERT  [CONN-SMD_5017]  24.02 87 0 top
TP10  CTRL_NRST  [CONN-SMD_5017]  62.84 81.92 0 top
TP11  CTRL_SWDIO  [CONN-SMD_5017]  67.92 81.92 0 top
TP12  CTRL_SWCLK  [CONN-SMD_5017]  73 81.92 0 top
TP13  VDD_CTRL  [CONN-SMD_5017]  78.08 81.92 0 top
TP14  GND  [CONN-SMD_5017]  83.16 81.92 0 top
TP15  STLINK_SWO_TDO  [CONN-SMD_5017]  95.25 72.14 0 top
U1  AP63203WU-7  [TSOT-26_L2.9-W1.6-P0.95-LS2.8-BL]  85.55 58.74 180 top
U2  INA226AIDGSR  [MSOP-10_L3.0-W3.0-P0.50-LS5.0-BL]  92.71 7.11 0 top
U3  STLINK-V3MODS  [COMM-SMD_STLINK-V3MODS_1]  105.79 69.47 0 top
U10  USB / SWD MUX  [MSOP-10_L3.0-W3.0-P0.50-LS5.0-BL]  100.58 54.36 0 top
USB1  ESP32 USB-C / USB4085-GF-A (TH)  [USC-C-SMD_USB4085-GF-A]  123.7 84.33 180 top

## Footprints (pads in the part's own frame, mm; a bottom-side part is the same pattern mirrored in y, then rotated)
C0603
  rect 0.8x0.9 smd: 1(-0.7,0) 2(0.7,0)
C0805
  rect 1.41x1.35 smd: 1(-1,0) 2(1,0)
COMM-SMD_STLINK-V3MODS_1
  rect 1.9x1.07 smd: 1(-7.32,9.525) 2(-7.32,8.255) 3(-7.32,6.985) 4(-7.32,5.715) 5(-7.32,4.445) 6(-7.32,3.175) 7(-7.32,1.905) 8(-7.32,0.635) 9(-7.32,-0.635) 10(-7.32,-1.905) 11(-7.32,-3.175) 12(-7.32,-4.445) 13(-7.32,-5.715) 14(-7.32,-6.985) 15(-7.32,-8.255) 16(-7.32,-9.525) 17(7.32,-9.525) 18(7.32,-8.255) 19(7.32,-6.985) 20(7.32,-5.715) 21(7.32,-4.445) 22(7.32,-3.175) 23(7.32,-1.905) 24(7.32,-0.635) 25(7.32,0.635) 26(7.32,1.905) 27(7.32,3.175) 28(7.32,4.445) 29(7.32,5.715) 30(7.32,6.985) 31(7.32,8.255) 32(7.32,9.525)
CONN-SMD_5017
  rect 3.43x1.78 smd: 1(0,0)
F1812
  rect 1.407x3.499 smd: 1(-1.853,0) 2(1.853,0)
HDR-TH_1P-P2.54-V-M
  rect 1.7x1.7 hole 1.1: 1(0,0)
HDR-TH_2P-P2.54-V-M
  rect 2x2 hole 1.2: 1(-1.27,0)
  round 2 hole 1.2: 2(1.27,0)
HDR-TH_3P-P2.54-V-M_PZ254V-11-03P
  rect 1.7x1.7 hole 1.02: 1(-2.54,0)
  round 1.7 hole 1.02: 2(0,0) 3(2.54,0)
HDR-TH_6P-P2.54-V-M
  rect 1.7x1.7 hole 1.1: 1(-6.35,0)
  round 1.7 hole 1.1: 2(-3.81,0) 3(-1.27,0) 4(1.27,0) 5(3.81,0) 6(6.35,0)
HDR-TH_8P-P2.54-V-F-1
  rect 1.801x1.801 hole 1.2: 1(-8.89,0)
  round 1.801 hole 1.2: 2(-6.35,0) 3(-3.81,0) 4(-1.27,0) 5(1.27,0) 6(3.81,0) 7(6.35,0) 8(8.89,0)
HDR-TH_8P-P2.54-V-M
  rect 1.801x1.801 hole 1: 1(-8.89,0)
  round 1.801 hole 1: 2(-6.35,0) 3(-3.81,0) 4(-1.27,0) 5(1.27,0) 6(3.81,0) 7(6.35,0) 8(8.89,0)
HDR-TH_10P-P2.54-V-F
  rect 1.575x1.7 hole 1.1: 1(-11.43,0)
  round 1.7 hole 1.1: 2(-8.89,0) 3(-6.35,0) 4(-3.81,0) 5(-1.27,0) 6(1.27,0) 7(3.81,0) 8(6.35,0) 9(8.89,0) 10(11.43,0)
IND-SMD_L4.0-W4.0
  rect 1.6x3.5 smd: 1(-1.6,0) 2(1.6,0)
LED0805-R-RD
  rect 1x1.399 smd: 1(1.05,0) 2(-1.05,0)
MSOP-10_L3.0-W3.0-P0.50-LS5.0-BL
  oval 0.28x1.62 smd: 1(-1,-2.11) 2(-0.5,-2.11) 3(0,-2.11) 4(0.5,-2.11) 5(1,-2.11) 6(1,2.11) 7(0.5,2.11) 8(0,2.11) 9(-0.5,2.11) 10(-1,2.11)
Pad_e291
  round 3.2 hole 3.2: MH1(0,0)
Pad_e292
  round 3.2 hole 3.2: MH2(0,0)
Pad_e293
  round 3.2 hole 3.2: MH3(0,0)
Pad_e294
  round 3.2 hole 3.2: MH4(0,0)
Pad_e307
  round 3.2 hole 3.2: MH_LCD1(0,0)
Pad_e308
  round 3.2 hole 3.2: MH_LCD2(0,0)
Pad_e309
  round 3.2 hole 3.2: MH_LCD3(0,0)
Pad_e310
  round 3.2 hole 3.2: MH_LCD4(0,0)
Pad_e316
  round 1.801 hole 1: PROTO_R01C01(0,0)
Pad_e317
  round 1.801 hole 1: PROTO_R01C02(0,0)
Pad_e318
  round 1.801 hole 1: PROTO_R01C03(0,0)
Pad_e319
  round 1.801 hole 1: PROTO_R01C04(0,0)
Pad_e320
  round 1.801 hole 1: PROTO_R01C05(0,0)
Pad_e321
  round 1.801 hole 1: PROTO_R01C06(0,0)
Pad_e322
  round 1.801 hole 1: PROTO_R01C07(0,0)
Pad_e323
  round 1.801 hole 1: PROTO_R01C08(0,0)
Pad_e324
  round 1.801 hole 1: PROTO_R01C09(0,0)
Pad_e325
  round 1.801 hole 1: PROTO_R02C01(0,0)
Pad_e326
  round 1.801 hole 1: PROTO_R02C02(0,0)
Pad_e327
  round 1.801 hole 1: PROTO_R02C03(0,0)
Pad_e328
  round 1.801 hole 1: PROTO_R02C04(0,0)
Pad_e329
  round 1.801 hole 1: PROTO_R02C05(0,0)
Pad_e330
  round 1.801 hole 1: PROTO_R02C06(0,0)
Pad_e331
  round 1.801 hole 1: PROTO_R02C07(0,0)
Pad_e332
  round 1.801 hole 1: PROTO_R02C08(0,0)
Pad_e333
  round 1.801 hole 1: PROTO_R02C09(0,0)
Pad_e334
  round 1.801 hole 1: PROTO_R03C01(0,0)
Pad_e335
  round 1.801 hole 1: PROTO_R03C02(0,0)
Pad_e336
  round 1.801 hole 1: PROTO_R03C03(0,0)
Pad_e337
  round 1.801 hole 1: PROTO_R03C04(0,0)
Pad_e338
  round 1.801 hole 1: PROTO_R03C05(0,0)
Pad_e339
  round 1.801 hole 1: PROTO_R03C06(0,0)
Pad_e340
  round 1.801 hole 1: PROTO_R03C07(0,0)
Pad_e341
  round 1.801 hole 1: PROTO_R03C08(0,0)
Pad_e342
  round 1.801 hole 1: PROTO_R03C09(0,0)
Pad_e343
  round 1.801 hole 1: PROTO_R04C01(0,0)
Pad_e344
  round 1.801 hole 1: PROTO_R04C02(0,0)
Pad_e345
  round 1.801 hole 1: PROTO_R04C03(0,0)
Pad_e346
  round 1.801 hole 1: PROTO_R04C04(0,0)
Pad_e347
  round 1.801 hole 1: PROTO_R04C05(0,0)
Pad_e348
  round 1.801 hole 1: PROTO_R04C06(0,0)
Pad_e349
  round 1.801 hole 1: PROTO_R04C07(0,0)
Pad_e350
  round 1.801 hole 1: PROTO_R04C08(0,0)
Pad_e351
  round 1.801 hole 1: PROTO_R04C09(0,0)
Pad_e352
  round 1.801 hole 1: PROTO_R05C01(0,0)
Pad_e353
  round 1.801 hole 1: PROTO_R05C02(0,0)
Pad_e354
  round 1.801 hole 1: PROTO_R05C03(0,0)
Pad_e355
  round 1.801 hole 1: PROTO_R05C04(0,0)
Pad_e356
  round 1.801 hole 1: PROTO_R05C05(0,0)
Pad_e357
  round 1.801 hole 1: PROTO_R05C06(0,0)
Pad_e358
  round 1.801 hole 1: PROTO_R05C07(0,0)
Pad_e359
  round 1.801 hole 1: PROTO_R05C08(0,0)
Pad_e360
  round 1.801 hole 1: PROTO_R05C09(0,0)
Pad_e361
  round 1.801 hole 1: PROTO_R06C01(0,0)
Pad_e362
  round 1.801 hole 1: PROTO_R06C02(0,0)
Pad_e363
  round 1.801 hole 1: PROTO_R06C03(0,0)
Pad_e364
  round 1.801 hole 1: PROTO_R06C04(0,0)
Pad_e365
  round 1.801 hole 1: PROTO_R06C05(0,0)
Pad_e366
  round 1.801 hole 1: PROTO_R06C06(0,0)
Pad_e367
  round 1.801 hole 1: PROTO_R06C07(0,0)
Pad_e368
  round 1.801 hole 1: PROTO_R06C08(0,0)
Pad_e369
  round 1.801 hole 1: PROTO_R06C09(0,0)
Pad_e370
  round 1.801 hole 1: PROTO_R07C01(0,0)
Pad_e371
  round 1.801 hole 1: PROTO_R07C02(0,0)
Pad_e372
  round 1.801 hole 1: PROTO_R07C03(0,0)
Pad_e373
  round 1.801 hole 1: PROTO_R07C04(0,0)
Pad_e374
  round 1.801 hole 1: PROTO_R07C05(0,0)
Pad_e375
  round 1.801 hole 1: PROTO_R07C06(0,0)
Pad_e376
  round 1.801 hole 1: PROTO_R07C07(0,0)
Pad_e377
  round 1.801 hole 1: PROTO_R07C08(0,0)
Pad_e378
  round 1.801 hole 1: PROTO_R07C09(0,0)
Pad_e379
  round 1.801 hole 1: PROTO_R08C01(0,0)
Pad_e380
  round 1.801 hole 1: PROTO_R08C02(0,0)
Pad_e381
  round 1.801 hole 1: PROTO_R08C03(0,0)
Pad_e382
  round 1.801 hole 1: PROTO_R08C04(0,0)
Pad_e383
  round 1.801 hole 1: PROTO_R08C05(0,0)
Pad_e384
  round 1.801 hole 1: PROTO_R08C06(0,0)
Pad_e385
  round 1.801 hole 1: PROTO_R08C07(0,0)
Pad_e386
  round 1.801 hole 1: PROTO_R08C08(0,0)
Pad_e387
  round 1.801 hole 1: PROTO_R08C09(0,0)
Pad_e388
  round 1.801 hole 1: PROTO_R09C01(0,0)
Pad_e389
  round 1.801 hole 1: PROTO_R09C02(0,0)
Pad_e390
  round 1.801 hole 1: PROTO_R09C03(0,0)
Pad_e391
  round 1.801 hole 1: PROTO_R09C04(0,0)
Pad_e392
  round 1.801 hole 1: PROTO_R09C05(0,0)
Pad_e393
  round 1.801 hole 1: PROTO_R09C06(0,0)
Pad_e394
  round 1.801 hole 1: PROTO_R09C07(0,0)
Pad_e395
  round 1.801 hole 1: PROTO_R09C08(0,0)
Pad_e396
  round 1.801 hole 1: PROTO_R09C09(0,0)
Pad_e397
  round 1.801 hole 1: PROTO_R01C10(0,0)
Pad_e398
  round 1.801 hole 1: PROTO_R02C10(0,0)
Pad_e399
  round 1.801 hole 1: PROTO_R03C10(0,0)
Pad_e400
  round 1.801 hole 1: PROTO_R04C10(0,0)
Pad_e401
  round 1.801 hole 1: PROTO_R05C10(0,0)
Pad_e402
  round 1.801 hole 1: PROTO_R06C10(0,0)
Pad_e403
  round 1.801 hole 1: PROTO_R07C10(0,0)
Pad_e404
  round 1.801 hole 1: PROTO_R08C10(0,0)
Pad_e405
  round 1.801 hole 1: PROTO_R09C10(0,0)
Pad_e406
  round 1.801 hole 1: PROTO_R10C01(0,0)
Pad_e407
  round 1.801 hole 1: PROTO_R10C02(0,0)
Pad_e408
  round 1.801 hole 1: PROTO_R10C03(0,0)
Pad_e409
  round 1.801 hole 1: PROTO_R10C04(0,0)
Pad_e410
  round 1.801 hole 1: PROTO_R10C05(0,0)
Pad_e411
  round 1.801 hole 1: PROTO_R10C06(0,0)
Pad_e412
  round 1.801 hole 1: PROTO_R10C07(0,0)
Pad_e413
  round 1.801 hole 1: PROTO_R10C08(0,0)
Pad_e414
  round 1.801 hole 1: PROTO_R10C09(0,0)
Pad_e415
  round 1.801 hole 1: PROTO_R10C10(0,0)
Pad_e416
  round 1.8 hole 1: PROTO2_R02C01(0,0)
Pad_e417
  round 1.8 hole 1: PROTO2_R02C02(0,0)
Pad_e418
  round 1.8 hole 1: PROTO2_R02C03(0,0)
Pad_e419
  round 1.8 hole 1: PROTO2_R02C05(0,0)
Pad_e420
  round 1.8 hole 1: PROTO2_R02C06(0,0)
Pad_e421
  round 1.8 hole 1: PROTO2_R02C07(0,0)
Pad_e422
  round 1.8 hole 1: PROTO2_R02C08(0,0)
Pad_e423
  round 1.8 hole 1: PROTO2_R02C09(0,0)
Pad_e424
  round 1.8 hole 1: PROTO2_R02C10(0,0)
Pad_e425
  round 1.8 hole 1: PROTO2_R03C01(0,0)
Pad_e426
  round 1.8 hole 1: PROTO2_R03C02(0,0)
Pad_e427
  round 1.8 hole 1: PROTO2_R03C03(0,0)
Pad_e428
  round 1.8 hole 1: PROTO2_R03C05(0,0)
Pad_e429
  round 1.8 hole 1: PROTO2_R03C06(0,0)
Pad_e430
  round 1.8 hole 1: PROTO2_R03C07(0,0)
Pad_e431
  round 1.8 hole 1: PROTO2_R03C08(0,0)
Pad_e432
  round 1.8 hole 1: PROTO2_R03C09(0,0)
Pad_e433
  round 1.8 hole 1: PROTO2_R03C10(0,0)
Pad_e434
  round 1.8 hole 1: PROTO2_R04C01(0,0)
Pad_e435
  round 1.8 hole 1: PROTO2_R04C02(0,0)
Pad_e436
  round 1.8 hole 1: PROTO2_R04C03(0,0)
Pad_e437
  round 1.8 hole 1: PROTO2_R04C04(0,0)
Pad_e438
  round 1.8 hole 1: PROTO2_R04C05(0,0)
Pad_e439
  round 1.8 hole 1: PROTO2_R04C06(0,0)
Pad_e440
  round 1.8 hole 1: PROTO2_R04C07(0,0)
Pad_e441
  round 1.8 hole 1: PROTO2_R04C08(0,0)
Pad_e442
  round 1.8 hole 1: PROTO2_R04C09(0,0)
Pad_e443
  round 1.8 hole 1: PROTO2_R04C10(0,0)
Pad_e444
  round 1.8 hole 1: PROTO2_R05C01(0,0)
Pad_e445
  round 1.8 hole 1: PROTO2_R05C02(0,0)
Pad_e446
  round 1.8 hole 1: PROTO2_R05C03(0,0)
Pad_e447
  round 1.8 hole 1: PROTO2_R05C04(0,0)
Pad_e448
  round 1.8 hole 1: PROTO2_R05C05(0,0)
Pad_e449
  round 1.8 hole 1: PROTO2_R05C06(0,0)
Pad_e450
  round 1.8 hole 1: PROTO2_R05C07(0,0)
Pad_e451
  round 1.8 hole 1: PROTO2_R05C08(0,0)
Pad_e452
  round 1.8 hole 1: PROTO2_R05C09(0,0)
Pad_e453
  round 1.8 hole 1: PROTO2_R05C10(0,0)
Pad_e454
  round 1.8 hole 1: PROTO2_R06C01(0,0)
Pad_e455
  round 1.8 hole 1: PROTO2_R06C02(0,0)
Pad_e456
  round 1.8 hole 1: PROTO2_R06C03(0,0)
Pad_e457
  round 1.8 hole 1: PROTO2_R06C04(0,0)
Pad_e458
  round 1.8 hole 1: PROTO2_R06C05(0,0)
Pad_e459
  round 1.8 hole 1: PROTO2_R06C06(0,0)
Pad_e460
  round 1.8 hole 1: PROTO2_R06C07(0,0)
Pad_e461
  round 1.8 hole 1: PROTO2_R06C08(0,0)
Pad_e462
  round 1.8 hole 1: PROTO2_R06C09(0,0)
Pad_e463
  round 1.8 hole 1: PROTO2_R06C10(0,0)
Pad_e464
  round 1.8 hole 1: PROTO2_R07C01(0,0)
Pad_e465
  round 1.8 hole 1: PROTO2_R07C02(0,0)
Pad_e466
  round 1.8 hole 1: PROTO2_R07C03(0,0)
Pad_e467
  round 1.8 hole 1: PROTO2_R07C04(0,0)
Pad_e468
  round 1.8 hole 1: PROTO2_R07C05(0,0)
Pad_e469
  round 1.8 hole 1: PROTO2_R07C06(0,0)
Pad_e470
  round 1.8 hole 1: PROTO2_R07C07(0,0)
Pad_e471
  round 1.8 hole 1: PROTO2_R07C08(0,0)
Pad_e472
  round 1.8 hole 1: PROTO2_R07C09(0,0)
Pad_e473
  round 1.8 hole 1: PROTO2_R07C10(0,0)
Pad_e474
  round 1.8 hole 1: PROTO2_R08C01(0,0)
Pad_e475
  round 1.8 hole 1: PROTO2_R08C02(0,0)
Pad_e476
  round 1.8 hole 1: PROTO2_R08C03(0,0)
Pad_e477
  round 1.8 hole 1: PROTO2_R08C04(0,0)
Pad_e478
  round 1.8 hole 1: PROTO2_R08C05(0,0)
Pad_e479
  round 1.8 hole 1: PROTO2_R08C06(0,0)
Pad_e480
  round 1.8 hole 1: PROTO2_R08C07(0,0)
Pad_e481
  round 1.8 hole 1: PROTO2_R08C08(0,0)
Pad_e482
  round 1.8 hole 1: PROTO2_R08C09(0,0)
Pad_e483
  round 1.8 hole 1: PROTO2_R08C10(0,0)
Pad_e484
  round 1.8 hole 1: PROTO2_R09C01(0,0)
Pad_e485
  round 1.8 hole 1: PROTO2_R09C02(0,0)
Pad_e486
  round 1.8 hole 1: PROTO2_R09C03(0,0)
Pad_e487
  round 1.8 hole 1: PROTO2_R09C04(0,0)
Pad_e488
  round 1.8 hole 1: PROTO2_R09C05(0,0)
Pad_e489
  round 1.8 hole 1: PROTO2_R09C06(0,0)
Pad_e490
  round 1.8 hole 1: PROTO2_R09C07(0,0)
Pad_e491
  round 1.8 hole 1: PROTO2_R09C08(0,0)
Pad_e492
  round 1.8 hole 1: PROTO2_R09C09(0,0)
Pad_e493
  round 1.8 hole 1: PROTO2_R09C10(0,0)
Pad_e494
  round 1.8 hole 1: PROTO2_R10C01(0,0)
Pad_e495
  round 1.8 hole 1: PROTO2_R10C02(0,0)
Pad_e496
  round 1.8 hole 1: PROTO2_R10C03(0,0)
Pad_e497
  round 1.8 hole 1: PROTO2_R10C04(0,0)
Pad_e498
  round 1.8 hole 1: PROTO2_R10C05(0,0)
Pad_e499
  round 1.8 hole 1: PROTO2_R10C06(0,0)
Pad_e500
  round 1.8 hole 1: PROTO2_R10C07(0,0)
Pad_e501
  round 1.8 hole 1: PROTO2_R10C08(0,0)
Pad_e502
  round 1.8 hole 1: PROTO2_R10C09(0,0)
Pad_e503
  round 1.8 hole 1: PROTO2_R10C10(0,0)
Pad_e504
  round 1.8 hole 1: PROTO2_R11C01(0,0)
Pad_e505
  round 1.8 hole 1: PROTO2_R11C02(0,0)
Pad_e506
  round 1.8 hole 1: PROTO2_R11C03(0,0)
Pad_e507
  round 1.8 hole 1: PROTO2_R11C04(0,0)
Pad_e508
  round 1.8 hole 1: PROTO2_R11C05(0,0)
Pad_e509
  round 1.8 hole 1: PROTO2_R11C06(0,0)
Pad_e510
  round 1.8 hole 1: PROTO2_R11C07(0,0)
Pad_e511
  round 1.8 hole 1: PROTO2_R11C08(0,0)
Pad_e512
  round 1.8 hole 1: PROTO2_R11C09(0,0)
Pad_e513
  round 1.8 hole 1: PROTO2_R11C10(0,0)
Pad_e514
  round 1.8 hole 1: PROTO2_R12C01(0,0)
Pad_e515
  round 1.8 hole 1: PROTO2_R12C02(0,0)
Pad_e516
  round 1.8 hole 1: PROTO2_R12C03(0,0)
Pad_e517
  round 1.8 hole 1: PROTO2_R12C04(0,0)
Pad_e518
  round 1.8 hole 1: PROTO2_R12C05(0,0)
Pad_e519
  round 1.8 hole 1: PROTO2_R12C06(0,0)
Pad_e520
  round 1.8 hole 1: PROTO2_R12C07(0,0)
Pad_e521
  round 1.8 hole 1: PROTO2_R12C08(0,0)
Pad_e522
  round 1.8 hole 1: PROTO2_R12C09(0,0)
Pad_e523
  round 1.8 hole 1: PROTO2_R12C10(0,0)
Pad_e524
  round 1.8 hole 1: PROTO2_R13C01(0,0)
Pad_e525
  round 1.8 hole 1: PROTO2_R13C02(0,0)
Pad_e526
  round 1.8 hole 1: PROTO2_R13C03(0,0)
Pad_e527
  round 1.8 hole 1: PROTO2_R13C04(0,0)
Pad_e528
  round 1.8 hole 1: PROTO2_R13C05(0,0)
Pad_e529
  round 1.8 hole 1: PROTO2_R13C06(0,0)
Pad_e530
  round 1.8 hole 1: PROTO2_R13C07(0,0)
Pad_e531
  round 1.8 hole 1: PROTO2_R13C08(0,0)
Pad_e532
  round 1.8 hole 1: PROTO2_R13C09(0,0)
Pad_e533
  round 1.8 hole 1: PROTO2_R13C10(0,0)
Pad_e534
  round 1.8 hole 1: PROTO2_R14C01(0,0)
Pad_e535
  round 1.8 hole 1: PROTO2_R14C02(0,0)
Pad_e536
  round 1.8 hole 1: PROTO2_R14C03(0,0)
Pad_e537
  round 1.8 hole 1: PROTO2_R14C04(0,0)
Pad_e538
  round 1.8 hole 1: PROTO2_R14C05(0,0)
Pad_e539
  round 1.8 hole 1: PROTO2_R14C06(0,0)
Pad_e540
  round 1.8 hole 1: PROTO2_R14C07(0,0)
Pad_e541
  round 1.8 hole 1: PROTO2_R14C08(0,0)
Pad_e542
  round 1.8 hole 1: PROTO2_R14C09(0,0)
Pad_e543
  round 1.8 hole 1: PROTO2_R14C10(0,0)
Pad_e544
  round 1.8 hole 1: PROTO2_R15C01(0,0)
Pad_e545
  round 1.8 hole 1: PROTO2_R15C02(0,0)
Pad_e546
  round 1.8 hole 1: PROTO2_R15C03(0,0)
Pad_e547
  round 1.8 hole 1: PROTO2_R15C04(0,0)
Pad_e548
  round 1.8 hole 1: PROTO2_R15C05(0,0)
Pad_e549
  round 1.8 hole 1: PROTO2_R15C06(0,0)
Pad_e550
  round 1.8 hole 1: PROTO2_R15C07(0,0)
Pad_e551
  round 1.8 hole 1: PROTO2_R15C08(0,0)
Pad_e552
  round 1.8 hole 1: PROTO2_R15C09(0,0)
Pad_e553
  round 1.8 hole 1: PROTO2_R15C10(0,0)
Pad_e554
  round 1.8 hole 1: PROTO3_R01C01(0,0)
Pad_e555
  round 1.8 hole 1: PROTO3_R01C02(0,0)
Pad_e556
  round 1.8 hole 1: PROTO3_R01C03(0,0)
Pad_e557
  round 1.8 hole 1: PROTO3_R01C04(0,0)
Pad_e558
  round 1.8 hole 1: PROTO3_R01C05(0,0)
Pad_e559
  round 1.8 hole 1: PROTO3_R01C06(0,0)
Pad_e560
  round 1.8 hole 1: PROTO3_R02C01(0,0)
Pad_e561
  round 1.8 hole 1: PROTO3_R02C02(0,0)
Pad_e562
  round 1.8 hole 1: PROTO3_R02C03(0,0)
Pad_e563
  round 1.8 hole 1: PROTO3_R02C04(0,0)
Pad_e564
  round 1.8 hole 1: PROTO3_R02C05(0,0)
Pad_e565
  round 1.8 hole 1: PROTO3_R02C06(0,0)
Pad_e566
  round 1.8 hole 1: PROTO3_R03C01(0,0)
Pad_e567
  round 1.8 hole 1: PROTO3_R03C02(0,0)
Pad_e568
  round 1.8 hole 1: PROTO3_R03C03(0,0)
Pad_e569
  round 1.8 hole 1: PROTO3_R03C04(0,0)
Pad_e570
  round 1.8 hole 1: PROTO3_R03C05(0,0)
Pad_e571
  round 1.8 hole 1: PROTO3_R03C06(0,0)
Pad_e572
  round 1.8 hole 1: PROTO3_R04C01(0,0)
Pad_e573
  round 1.8 hole 1: PROTO3_R04C02(0,0)
Pad_e574
  round 1.8 hole 1: PROTO3_R04C03(0,0)
Pad_e575
  round 1.8 hole 1: PROTO3_R04C04(0,0)
Pad_e576
  round 1.8 hole 1: PROTO3_R04C05(0,0)
Pad_e577
  round 1.8 hole 1: PROTO3_R04C06(0,0)
Pad_e578
  round 1.8 hole 1: PROTO3_R05C01(0,0)
Pad_e579
  round 1.8 hole 1: PROTO3_R05C02(0,0)
Pad_e580
  round 1.8 hole 1: PROTO3_R05C03(0,0)
Pad_e581
  round 1.8 hole 1: PROTO3_R05C04(0,0)
Pad_e582
  round 1.8 hole 1: PROTO3_R05C05(0,0)
Pad_e583
  round 1.8 hole 1: PROTO3_R05C06(0,0)
Pad_e584
  round 1.8 hole 1: PROTO3_R06C01(0,0)
Pad_e585
  round 1.8 hole 1: PROTO3_R06C02(0,0)
Pad_e586
  round 1.8 hole 1: PROTO3_R06C03(0,0)
Pad_e587
  round 1.8 hole 1: PROTO3_R06C04(0,0)
Pad_e588
  round 1.8 hole 1: PROTO3_R06C05(0,0)
Pad_e589
  round 1.8 hole 1: PROTO3_R06C06(0,0)
Pad_e590
  round 1.8 hole 1: PROTO3_R07C01(0,0)
Pad_e591
  round 1.8 hole 1: PROTO3_R07C02(0,0)
Pad_e592
  round 1.8 hole 1: PROTO3_R07C03(0,0)
Pad_e593
  round 1.8 hole 1: PROTO3_R07C04(0,0)
Pad_e594
  round 1.8 hole 1: PROTO3_R07C05(0,0)
Pad_e595
  round 1.8 hole 1: PROTO3_R07C06(0,0)
Pad_e596
  round 1.8 hole 1: PROTO3_R08C01(0,0)
Pad_e597
  round 1.8 hole 1: PROTO3_R08C02(0,0)
Pad_e598
  round 1.8 hole 1: PROTO3_R08C03(0,0)
Pad_e599
  round 1.8 hole 1: PROTO3_R08C04(0,0)
Pad_e600
  round 1.8 hole 1: PROTO3_R08C05(0,0)
Pad_e601
  round 1.8 hole 1: PROTO3_R08C06(0,0)
Pad_e602
  round 1.8 hole 1: PROTO3_R09C01(0,0)
Pad_e603
  round 1.8 hole 1: PROTO3_R09C02(0,0)
Pad_e604
  round 1.8 hole 1: PROTO3_R09C03(0,0)
Pad_e605
  round 1.8 hole 1: PROTO3_R09C04(0,0)
Pad_e606
  round 1.8 hole 1: PROTO3_R09C05(0,0)
Pad_e607
  round 1.8 hole 1: PROTO3_R09C06(0,0)
Pad_e608
  round 1.8 hole 1: PROTO3_R10C01(0,0)
Pad_e609
  round 1.8 hole 1: PROTO3_R10C02(0,0)
Pad_e610
  round 1.8 hole 1: PROTO3_R10C03(0,0)
Pad_e611
  round 1.8 hole 1: PROTO3_R10C04(0,0)
Pad_e612
  round 1.8 hole 1: PROTO3_R10C05(0,0)
Pad_e613
  round 1.8 hole 1: PROTO3_R10C06(0,0)
Pad_e614
  round 1.8 hole 1: PROTO3_R11C01(0,0)
Pad_e615
  round 1.8 hole 1: PROTO3_R11C02(0,0)
Pad_e616
  round 1.8 hole 1: PROTO3_R11C03(0,0)
Pad_e617
  round 1.8 hole 1: PROTO3_R11C04(0,0)
Pad_e618
  round 1.8 hole 1: PROTO3_R11C05(0,0)
Pad_e619
  round 1.8 hole 1: PROTO3_R11C06(0,0)
Pad_e620
  round 1.8 hole 1: PROTO3_R12C01(0,0)
Pad_e621
  round 1.8 hole 1: PROTO3_R12C02(0,0)
Pad_e622
  round 1.8 hole 1: PROTO3_R12C03(0,0)
Pad_e623
  round 1.8 hole 1: PROTO3_R12C04(0,0)
Pad_e624
  round 1.8 hole 1: PROTO3_R12C05(0,0)
Pad_e625
  round 1.8 hole 1: PROTO3_R12C06(0,0)
Pad_e626
  round 1.8 hole 1: PROTO3_R13C01(0,0)
Pad_e627
  round 1.8 hole 1: PROTO3_R13C02(0,0)
Pad_e628
  round 1.8 hole 1: PROTO3_R13C03(0,0)
Pad_e629
  round 1.8 hole 1: PROTO3_R13C04(0,0)
Pad_e630
  round 1.8 hole 1: PROTO3_R13C05(0,0)
Pad_e631
  round 1.8 hole 1: PROTO3_R13C06(0,0)
Pad_e632
  round 1.8 hole 1: PROTO3_R14C01(0,0)
Pad_e633
  round 1.8 hole 1: PROTO3_R14C02(0,0)
Pad_e634
  round 1.8 hole 1: PROTO3_R14C03(0,0)
Pad_e635
  round 1.8 hole 1: PROTO3_R14C04(0,0)
Pad_e636
  round 1.8 hole 1: PROTO3_R14C05(0,0)
Pad_e637
  round 1.8 hole 1: PROTO3_R14C06(0,0)
Pad_e638
  round 1.8 hole 1: PROTO3_R15C01(0,0)
Pad_e639
  round 1.8 hole 1: PROTO3_R15C02(0,0)
Pad_e640
  round 1.8 hole 1: PROTO3_R15C03(0,0)
Pad_e641
  round 1.8 hole 1: PROTO3_R15C04(0,0)
Pad_e642
  round 1.8 hole 1: PROTO3_R15C05(0,0)
Pad_e643
  round 1.8 hole 1: PROTO3_R15C06(0,0)
Pad_e644
  round 1.8 hole 1: PROTO4_R01C01(0,0)
Pad_e645
  round 1.8 hole 1: PROTO4_R01C02(0,0)
Pad_e646
  round 1.8 hole 1: PROTO4_R01C03(0,0)
Pad_e647
  round 1.8 hole 1: PROTO4_R01C04(0,0)
Pad_e648
  round 1.8 hole 1: PROTO4_R01C05(0,0)
Pad_e649
  round 1.8 hole 1: PROTO4_R02C01(0,0)
Pad_e650
  round 1.8 hole 1: PROTO4_R02C02(0,0)
Pad_e651
  round 1.8 hole 1: PROTO4_R02C03(0,0)
Pad_e652
  round 1.8 hole 1: PROTO4_R02C04(0,0)
Pad_e653
  round 1.8 hole 1: PROTO4_R02C05(0,0)
Pad_e654
  round 1.8 hole 1: PROTO4_R03C01(0,0)
Pad_e655
  round 1.8 hole 1: PROTO4_R03C02(0,0)
Pad_e656
  round 1.8 hole 1: PROTO4_R03C03(0,0)
Pad_e657
  round 1.8 hole 1: PROTO4_R03C04(0,0)
Pad_e658
  round 1.8 hole 1: PROTO4_R03C05(0,0)
Pad_e659
  round 1.8 hole 1: PROTO4_R04C01(0,0)
Pad_e660
  round 1.8 hole 1: PROTO4_R04C02(0,0)
Pad_e661
  round 1.8 hole 1: PROTO4_R04C03(0,0)
Pad_e662
  round 1.8 hole 1: PROTO4_R04C04(0,0)
Pad_e663
  round 1.8 hole 1: PROTO4_R04C05(0,0)
Pad_e664
  round 1.8 hole 1: PROTO4_R05C01(0,0)
Pad_e665
  round 1.8 hole 1: PROTO4_R05C02(0,0)
Pad_e666
  round 1.8 hole 1: PROTO4_R05C03(0,0)
Pad_e667
  round 1.8 hole 1: PROTO4_R05C04(0,0)
Pad_e668
  round 1.8 hole 1: PROTO4_R05C05(0,0)
Pad_e669
  round 1.8 hole 1: PROTO4_R06C01(0,0)
Pad_e670
  round 1.8 hole 1: PROTO4_R06C02(0,0)
Pad_e671
  round 1.8 hole 1: PROTO4_R06C03(0,0)
Pad_e672
  round 1.8 hole 1: PROTO4_R06C04(0,0)
Pad_e673
  round 1.8 hole 1: PROTO4_R06C05(0,0)
Pad_e1120
  round 2.2 hole 2.2: MH_M2_1(0,0)
Pad_e1121
  round 2.2 hole 2.2: MH_M2_2(0,0)
Pad_e1701
  round 1.8 hole 1: PROTO2_R09C01(0,0)
Pad_e1702
  round 1.8 hole 1: PROTO2_R10C01(0,0)
Pad_e1703
  round 1.8 hole 1: PROTO2_R10C02(0,0)
Pad_e1704
  round 1.8 hole 1: PROTO2_R11C01(0,0)
Pad_e1705
  round 1.8 hole 1: PROTO2_R11C02(0,0)
Pad_e1706
  round 1.8 hole 1: PROTO2_R12C01(0,0)
Pad_e1707
  round 1.8 hole 1: PROTO2_R12C02(0,0)
Pad_e1708
  round 1.8 hole 1: PROTO2_R13C01(0,0)
Pad_e1709
  round 1.8 hole 1: PROTO2_R13C02(0,0)
Pad_e1710
  round 1.8 hole 1: PROTO2_R14C01(0,0)
Pad_e1711
  round 1.8 hole 1: PROTO2_R14C02(0,0)
Pad_e1712
  round 1.8 hole 1: PROTO2_R15C02(0,0)
Pad_e1713
  round 1.8 hole 1: PROTO2_R15C01(0,0)
Pad_e1714
  round 1.8 hole 1: PROTO2_R02C02(0,0)
Pad_e1715
  round 1.8 hole 1: PROTO2_R02C01(0,0)
Pad_e1716
  round 1.8 hole 1: PROTO2_R03C02(0,0)
Pad_e1717
  round 1.8 hole 1: PROTO2_R03C01(0,0)
Pad_e1718
  round 1.8 hole 1: PROTO2_R04C01(0,0)
Pad_e1719
  round 1.8 hole 1: PROTO2_R07C01(0,0)
Pad_e1720
  round 1.8 hole 1: PROTO2_R07C02(0,0)
Pad_e1721
  round 1.8 hole 1: PROTO2_R08C02(0,0)
Pad_e1722
  round 1.8 hole 1: PROTO2_R08C01(0,0)
Pad_e1723
  round 1.8 hole 1: PROTO2_R09C02(0,0)
Pad_e1724
  round 1.8 hole 1: PROTO2_R04C02(0,0)
Pad_e1725
  round 1.8 hole 1: PROTO2_R05C01(0,0)
Pad_e1726
  round 1.8 hole 1: PROTO2_R05C02(0,0)
Pad_e1727
  round 1.8 hole 1: PROTO2_R06C01(0,0)
Pad_e1728
  round 1.8 hole 1: PROTO2_R06C02(0,0)
Pad_e1787
  round 1.651 hole 0.635: IDOT(0,0)
Pad_e1858
  round 0.737 hole 0.254: LOGO_DOT1(0,0)
Pad_e1859
  round 0.737 hole 0.254: LOGO_DOT2(0,0)
Pad_e1860
  round 0.737 hole 0.254: LOGO_DOT3(0,0)
Pad_e1861
  round 0.737 hole 0.254: LOGO_DOT4(0,0)
Pad_e1862
  round 0.737 hole 0.254: LOGO_DOT5(0,0)
R0402
  rect 0.566x0.54 smd: 1(-0.433,0) 2(0.433,0)
R0603
  rect 0.806x0.864 smd: 1(-0.753,0) 2(0.753,0)
R2512
  rect 1.282x3.456 smd: 1(-3.067,0) 2(3.067,0)
SOD-123_L2.8-W1.8-LS3.7-RD
  rect 0.95x1.15 smd: 1(-1.692,0) 2(1.692,0)
SOT-23-6_L2.9-W1.6-P0.95-LS2.8-BL
  rect 0.532x1.072 smd: 1(-0.95,-1.149) 2(0,-1.149) 3(0.95,-1.149) 4(0.95,1.149) 5(0,1.149) 6(-0.95,1.149)
SOT-23_L2.9-W1.3-P1.90-LS2.4-BR
  rect 1x0.8 smd: 1(1.15,-0.95) 2(1.15,0.95) 3(-1.15,0)
SW-SMD_4P-L6.4-W6.3-P4.00-LS9.5
  rect 2x1 smd: 1(-4.75,2) 2(4.75,2) 3(-4.75,-2) 4(4.75,-2)
TSOT-26_L2.9-W1.6-P0.95-LS2.8-BL
  rect 0.55x1.1 smd: 1(-0.95,-1.2) 2(0,-1.2) 3(0.95,-1.2) 4(0.95,1.2) 5(0,1.2) 6(-0.95,1.2)
USC-C-SMD_USB4085-GF-A
  round 0.65 hole 0.4: A1(-2.975,2.18) A4(-2.125,2.18) A5(-1.275,2.18) A6(-0.425,2.18) A7(0.425,2.18) A8(1.275,2.18) A9(2.125,2.18) A12(2.975,2.18) B1(2.98,0.83) B4(2.13,0.83) B5(1.28,0.83) B6(0.43,0.83) B7(-0.42,0.83) B8(-1.27,0.83) B9(-2.12,0.83) B12(-2.975,0.83)
  oval 0.9x2.4 hole 0.6x2.1: S1(-4.325,1.2) S1(4.325,1.2)
  oval 0.9x1.7 hole 0.6x1.4: S1(-4.325,-2.18) S1(4.325,-2.18)

## Nets
As in the schematic, except:
LOGO_NC: NOREF#4.LOGO_DOT1 NOREF#9.LOGO_DOT5 NOREF#208.LOGO_DOT2 NOREF#241.LOGO_DOT3 NOREF#398.LOGO_DOT4
